# Altium schematic sheet S11_Busses.SchDoc
size 420 x 297 mm; SheetNumber: 11; SheetTotal: 11
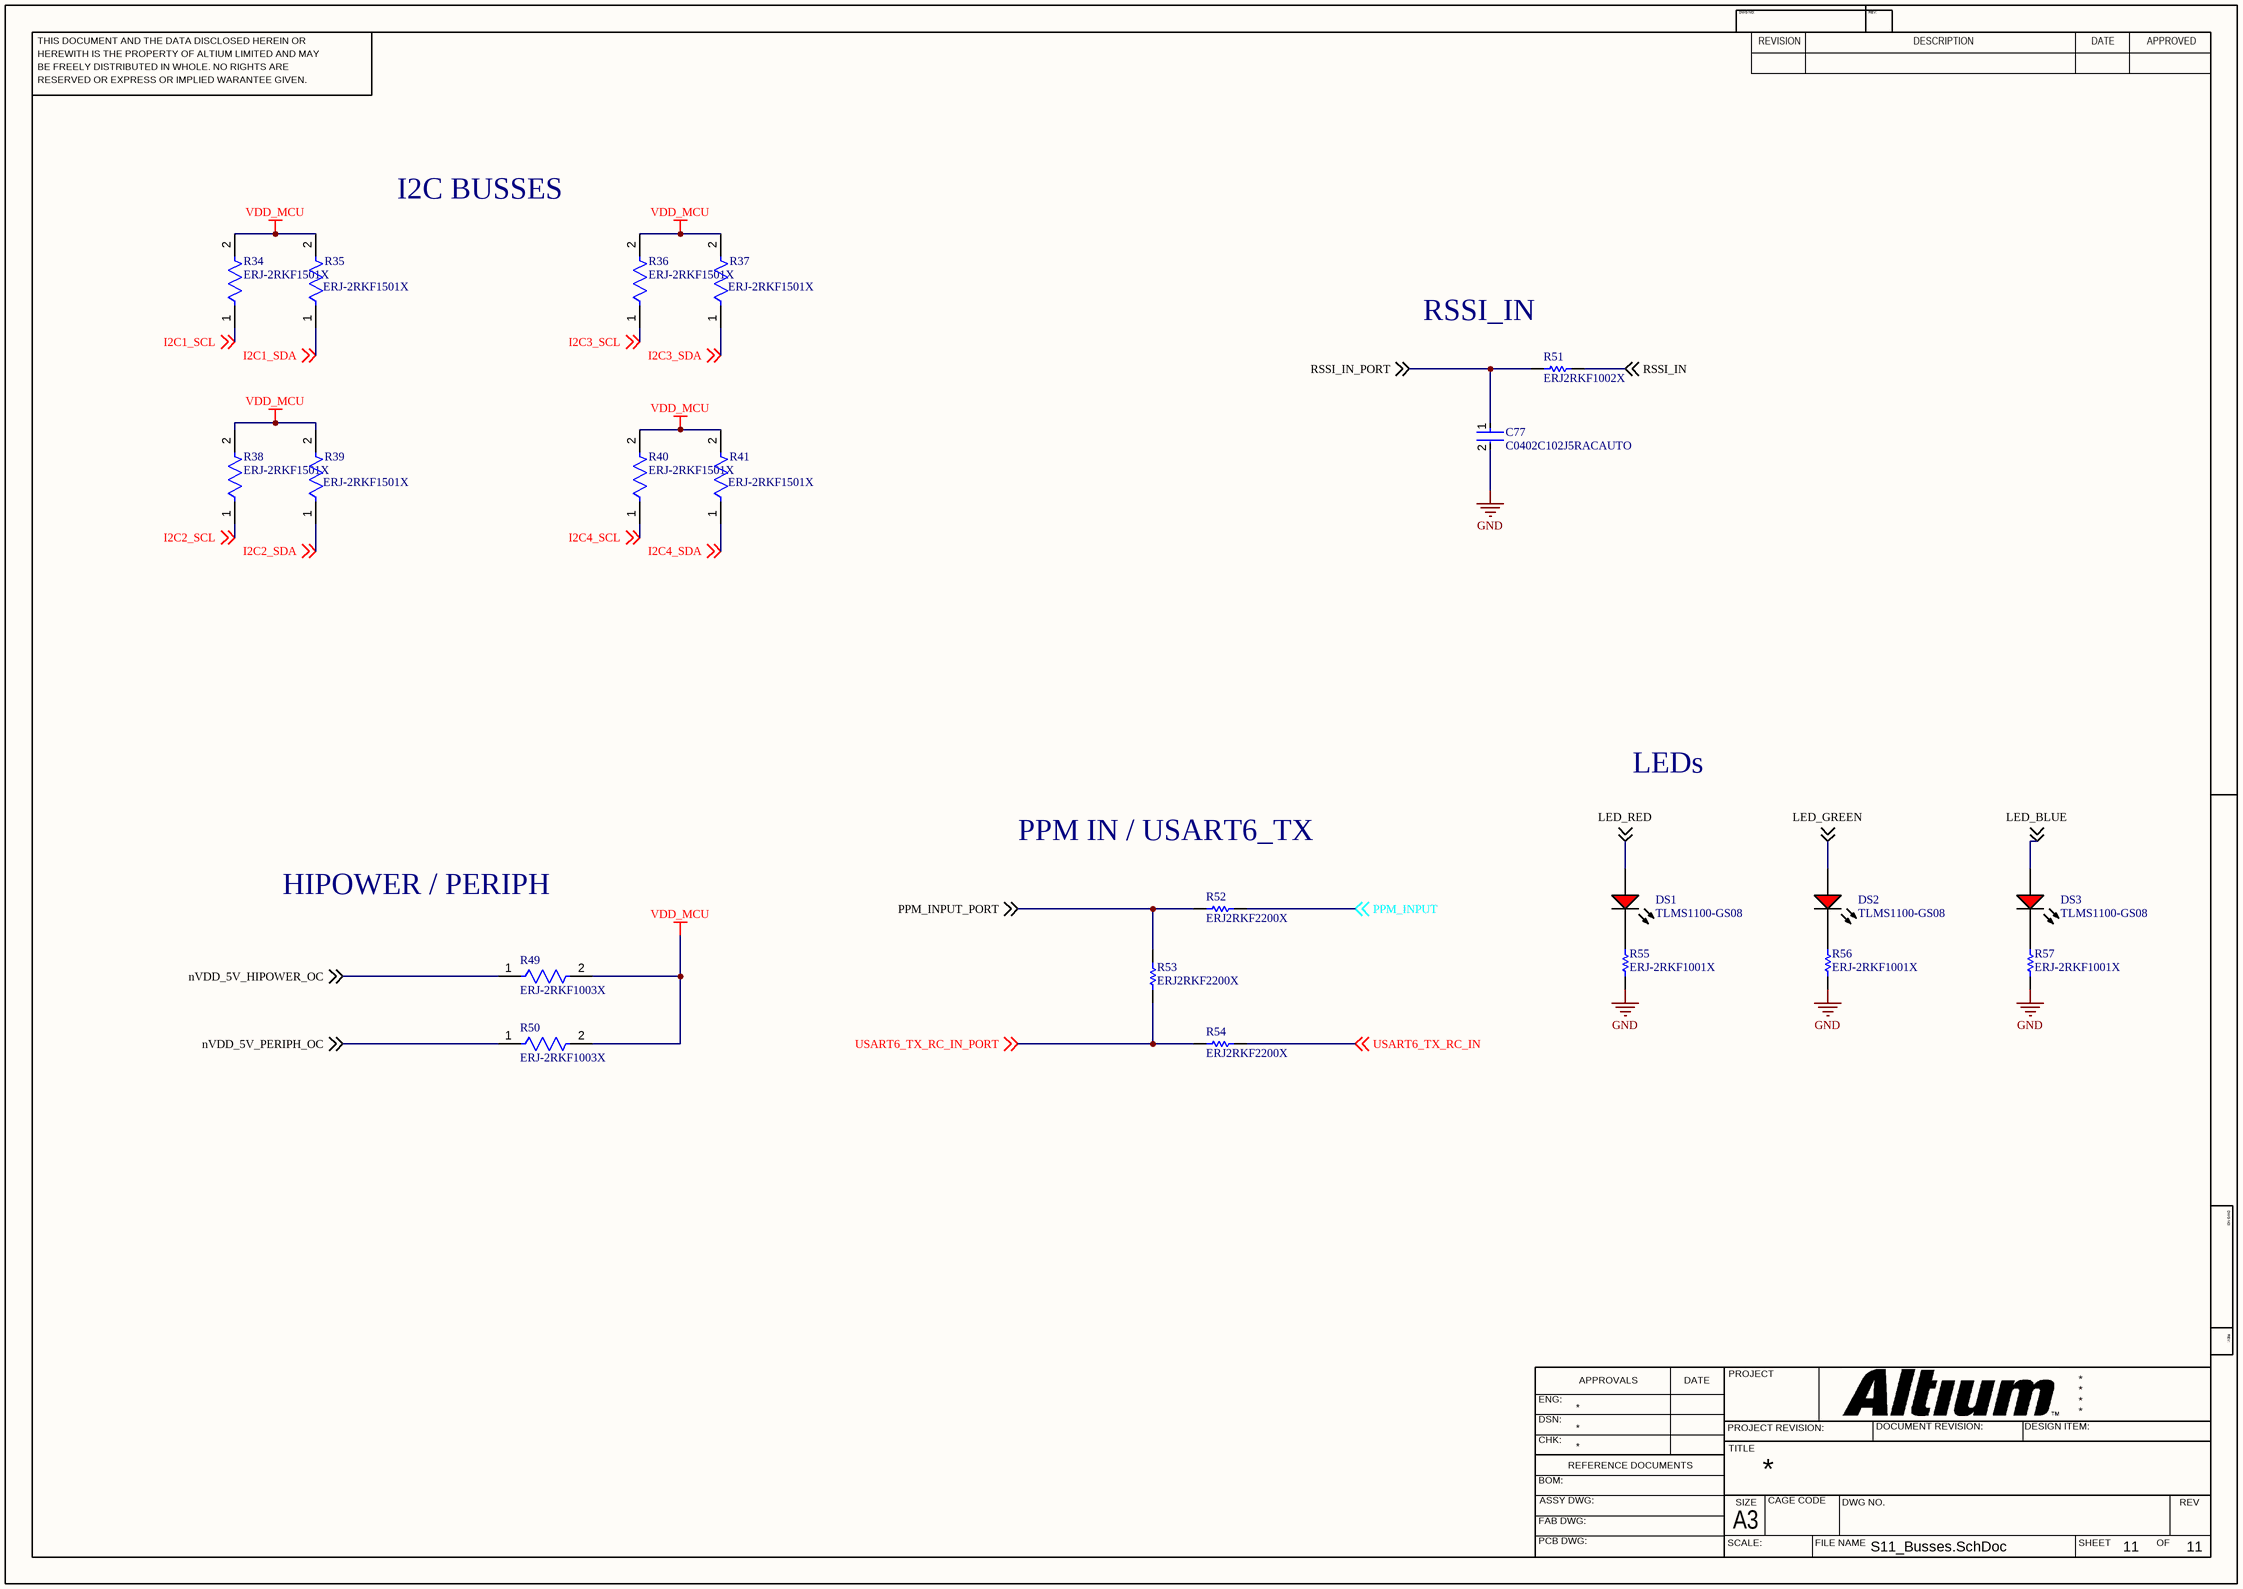
[diagram p0: S11_Busses.SchDoc]

## Parts
C77  C0402C102J5RACAUTO  [FP-C0402-BB-MFG]
DS1  TLMS1100-GS08  [VISH-TLMX1100_V]
DS2  TLMS1100-GS08  [VISH-TLMX1100_V]
DS3  TLMS1100-GS08  [VISH-TLMX1100_V]
R34  ERJ-2RKF1501X  [FP-ERJ2RK-IPC_A]
R35  ERJ-2RKF1501X  [FP-ERJ2RK-IPC_A]
R36  ERJ-2RKF1501X  [FP-ERJ2RK-IPC_A]
R37  ERJ-2RKF1501X  [FP-ERJ2RK-IPC_A]
R38  ERJ-2RKF1501X  [FP-ERJ2RK-IPC_A]
R39  ERJ-2RKF1501X  [FP-ERJ2RK-IPC_A]
R40  ERJ-2RKF1501X  [FP-ERJ2RK-IPC_A]
R41  ERJ-2RKF1501X  [FP-ERJ2RK-IPC_A]
R49  ERJ-2RKF1003X  [FP-ERJ2RK-IPC_C]
R50  ERJ-2RKF1003X  [FP-ERJ2RK-IPC_C]
R51  ERJ2RKF1002X  [RESC1005X40X25LL05T05]
R52  ERJ2RKF2200X  [RESC1005X40X25LL05T05]
R53  ERJ2RKF2200X  [RESC1005X40X25LL05T05]
R54  ERJ2RKF2200X  [RESC1005X40X25LL05T05]
R55  ERJ-2RKF1001X  [RESC1005X40X25NL05T05]
R56  ERJ-2RKF1001X  [RESC1005X40X25NL05T05]
R57  ERJ-2RKF1001X  [RESC1005X40X25NL05T05]

## Nets
GND: C77.2 R55.1 R56.1 R57.1
VDD_MCU: R34.2 R35.2 R36.2 R37.2 R38.2 R39.2 R40.2 R41.2 R49.2 R50.2
I2C1_SCL: R34.1 ; off-sheet I2C1_SCL
I2C1_SDA: R35.1 ; off-sheet I2C1_SDA
I2C2_SCL: R38.1 ; off-sheet I2C2_SCL
I2C2_SDA: R39.1 ; off-sheet I2C2_SDA
I2C3_SCL: R36.1 ; off-sheet I2C3_SCL
I2C3_SDA: R37.1 ; off-sheet I2C3_SDA
I2C4_SCL: R40.1 ; off-sheet I2C4_SCL
I2C4_SDA: R41.1 ; off-sheet I2C4_SDA
LED_BLUE: DS3.1(A) ; off-sheet LED_BLUE
LED_GREEN: DS2.1(A) ; off-sheet LED_GREEN
LED_RED: DS1.1(A) ; off-sheet LED_RED
nVDD_5V_HIPOWER_OC: R49.1 ; off-sheet nVDD_5V_HIPOWER_OC
nVDD_5V_PERIPH_OC: R50.1 ; off-sheet nVDD_5V_PERIPH_OC
PPM_INPUT: R52.2 ; off-sheet PPM_INPUT
PPM_INPUT_PORT: R52.1 R53.2 ; off-sheet PPM_INPUT_PORT
RSSI_IN: R51.2 ; off-sheet RSSI_IN
RSSI_IN_PORT: C77.1 R51.1 ; off-sheet RSSI_IN_PORT
USART6_TX_RC_IN: R54.2 ; off-sheet USART6_TX_RC_IN
USART6_TX_RC_IN_PORT: R53.1 R54.1 ; off-sheet USART6_TX_RC_IN_PORT
NetDS1_2: DS1.2(K) R55.2
NetDS2_2: DS2.2(K) R56.2
NetDS3_2: DS3.2(K) R57.2

## Notes on the sheet
- I2C BUSSES
- (near R51) RSSI_IN
- LEDs
- PPM IN / USART6_TX
- HIPOWER / PERIPH
- THIS DOCUMENT AND THE DATA DISCLOSED HEREIN OR
- HEREWITH IS THE PROPERTY OF ALTIUM LIMITED AND MAY
- DWG NO:
- REVISION
- REV:
- DESCRIPTION
- DATE
- APPROVED
- BE FREELY DISTRIBUTED IN WHOLE. NO RIGHTS ARE
- RESERVED OR EXPRESS OR IMPLIED WARANTEE GIVEN.
- ENG:
- APPROVALS
- PROJECT
- DSN:
- CHK:
- REFERENCE DOCUMENTS
- PROJECT REVISION:
- TITLE
- DOCUMENT REVISION:
- DESIGN ITEM:
- BOM:
- FAB DWG:
- PCB DWG:
- ASSY DWG:
- SCALE:
- A3
- SIZE
- CAGE CODE
- FILE NAME
- DWG NO.
- SHEET
- OF
- REV

## Library data of the parts
C77 = CMP-03020-024111-1: C0402 1,000 pF X7R 5.00% 50 V; Manufacturer: Kemet; Voltage Rating: 50 V; Temperature Coefficient: 15%; Tolerance: 0.05; Material: Ceramic; Lead Free: Yes; Value: 1,000 pF; Package: C0402-BB; Automotive: No; ComponentLink2Description: Datasheet; Ipc Land Pattern Name: CAPC10050X50; Octopart: https://octopart.com/c0402c102j5racauto-kemet-81882731; Device Class L2: Capacitors; Capacitance: 1,000 pF; Temperature Characteristic: X7R; Category: Cap; RoHS: TRUE; Temperature Range High: +125°C; ComponentLink2URL: https://content.kemet.com/datasheets/KEM_C1002_X7R_SMD.pdf; Temperature: -55°C to +125°C; Temperature Range Low: -55°C; Device Class L3: Ceramic Capacitors; Device Class L1: Passive Components; Manufacturer Part Number: C0402C102J5RACAUTO; Height: 0.55mm
DS1-DS3 = CMP-1666-00027-1: LED, RED, 2.1 V, -40 to 100 degC, 2-Pin SMD (0603), RoHS, Tape and Reel; Type (Capacitors): C0G; Resistance: 100000000000 Ohm; Capacitance: 12 pF; Voltage Rating: 50 V; Tolerance: 5%; Min Operating Temperature: -55degC; REACH SVHC: No SVHC; ComponentLink2Description: Datasheet; ComponentLink1URL: http://www.vishay.com/; Width: 0.8 mm; Package Quantity: 4000; PackageReference: TLMX1100; ComponentLink2URL: http://www.vishay.com/docs/83173/tlmb1100.pdf; Case/Package: 0603; Case Code (Metric): 1608; Packaging: Tape and Reel; Pins: 2; ComponentLink1Description: Manufacturer URL; Max Operating Temperature: 125degC; Height: 0.8 mm; Length: 1.6 mm; Mount: Surface Mount; PackageDescription: 2-Pin Surface Mount Device, Body 1.6 x 0.8 mm; DatasheetVersion: Rev. 2.7, 03/2016; Case Code (Imperial): 0603; Voltage Rating (DC): 50 V; RoHSCompliant: True; Radiation Hardening: No
R34-R41 = CMP-2002-00693-2: RES SMD 1.5K OHM 1% 1/10W 0402; Voltage Rating (DC): 50V; Temperature Coefficient: 100ppm/°C; Power Rating: 100mW; Resistance: 1.5kR; Features: Automotive AEC-Q200; Termination: SMD/SMT; Size Code: 0402; Mount: Surface Mount; Min Operating Temperature: -55°C; Construction: Rectangular; Case Code (Metric): 1005; Depth: 0.5mm; Max Operating Temperature: 155°C; RoHS Compliant: Yes; Packaging: Tape and Reel; Number of Pins: 2; Military Standard: Not; Package Quantity: 1; Height: 0.35mm; Resistor Type: Thick Film; Radiation Hardening: No; Length: 1mm; Case Code (Imperial): 0402; Tolerance: 1%; Voltage Rating: 50V; Resistance Tolerance: 1%; Contact Plating: Tin; Case/Package: 0402; REACH SVHC: No SVHC; Max Power Dissipation: 100mW; Series: ERJ; Technology: THICK FILM; Number of Terminations: 2; Width: 0.02inch; Lead Free: Lead Free
R49 R50 = CMP-2002-00608-4: RES SMD 100K OHM 1% 1/10W 0402; Resistance: 100kR; Voltage Rating (DC): 50V; Power Rating: 100mW; Temperature Coefficient: 100ppm/°C; Case/Package: 0402; Length: 1mm; Package Quantity: 1; Radiation Hardening: No; Case Code (Metric): 1005; Contact Plating: Tin; Mount: Surface Mount; Depth: 0.5mm; Max Operating Temperature: 155°C; Lead Free: Lead Free; Width: 0.5mm; Composition: Thick Film; Case Code (Imperial): 0402; Tolerance: 1%; Termination: SMD/SMT; Number of Pins: 2; Height: 0.35mm; Voltage Rating: 50V; Military Standard: Not; REACH SVHC: No SVHC; Packaging: Tape and Reel; Min Operating Temperature: -55°C; Max Power Dissipation: 100mW; Features: Automotive AEC-Q200; Number of Terminations: 2
R51 = CMP-2000-07588-1: Chip Resistor, 10 KOhm, +/- 1%, 0.1 W, -55 to 155 degC, 0402 (1005 Metric), RoHS, Tape and Reel; Manufacturer: Panasonic; Power Rating: 100mW; Voltage Rating: 50V; Resistance: 10KOhm; Case\/Package: 0402; Temperature Coefficient: 100ppm\/degreesC; RoHSCompliant: True; Lead Free: LeadFree; Package Quantity: 1; Contact Plating: Tin; Length: 1mm; Radiation Hardening: No; REACH SVHC: NoSVHC; Max Operating Temperature: 155degC; Depth: 0.5mm; Case Code (Imperial): 0402; Military Standard: Not; Package Description: 2-Pin Surface Mount Device, Body 1 x 0.5 mm; Termination: SMD/SMT; Case Code (Metric): 1005; Height: 0.35mm; Packaging: TapeandReel; Voltage Rating (DC): 50V; Package Reference: 402; Number of Pins: 2; Tolerance: 1%; Mounting Technology: SurfaceMount; Width: 0.02inch; Mount: SurfaceMount; Datasheet URL: https://industrial.panasonic.com/cdbs/www-data/pdf/RDA0000/AOA0000C304.pdf; Composition: ThickFilm; Datasheet Version: 02/2017; Manufacturer URL: http://www.panasonic.com/; Max Power Dissipation: 100mW; Number of Terminations: 2; Min Operating Temperature: -55degC
R52-R54 = CMP-2002-01131-1: Manufacturer: Panasonic; Part Number: ERJ2RKF2200X
R55-R57 = CMP-1011-00510-4: Chip Resistor, 1 KOhm, +/- 1%, 100 mW, -55 to 155 degC, 0402 (1005 Metric), RoHS, Tape and Reel; Manufacturer: Basic Passives; Voltage Rating: 50 V; Case\/Package: 0402; Resistance: 1 KOhm; Power Rating: 100 mW; PartNumber: ERJ-2RKF1001X; DatasheetVersion: 04/2015; Radiation Hardening: No; Pins: 2; Height: 0.35 mm; RoHSCompliant: true; Case Code (Imperial): 0402; ComponentLink2Description: Datasheet; ComponentLink1Description: Manufacturer URL; PackageReference: 0402; Mount: Surface Mount; Package Quantity: 10000; Tolerance: 1%; ComponentLink1URL: http://www.panasonic.com/; PackageDescription: 2-Pin Surface Mount Device, Body 1 x 0.5 mm; Mounting Technology: Surface Mount; Case Code (Metric): 1005; ComponentLink2URL: http://industrial.panasonic.com/cdbs/www-data/pdf/RDA0000/AOA0000C86.pdf; REACH SVHC: Yes; Packaging: Tape and Reel; Max Operating Temperature: 155 degC; Min Operating Temperature: -55 degC; Width: 0.5 mm; Length: 1 mm